# Altium schematic sheet POWER.SchDoc
size 381 x 241 mm; SheetNumber: 3; SheetTotal: 3
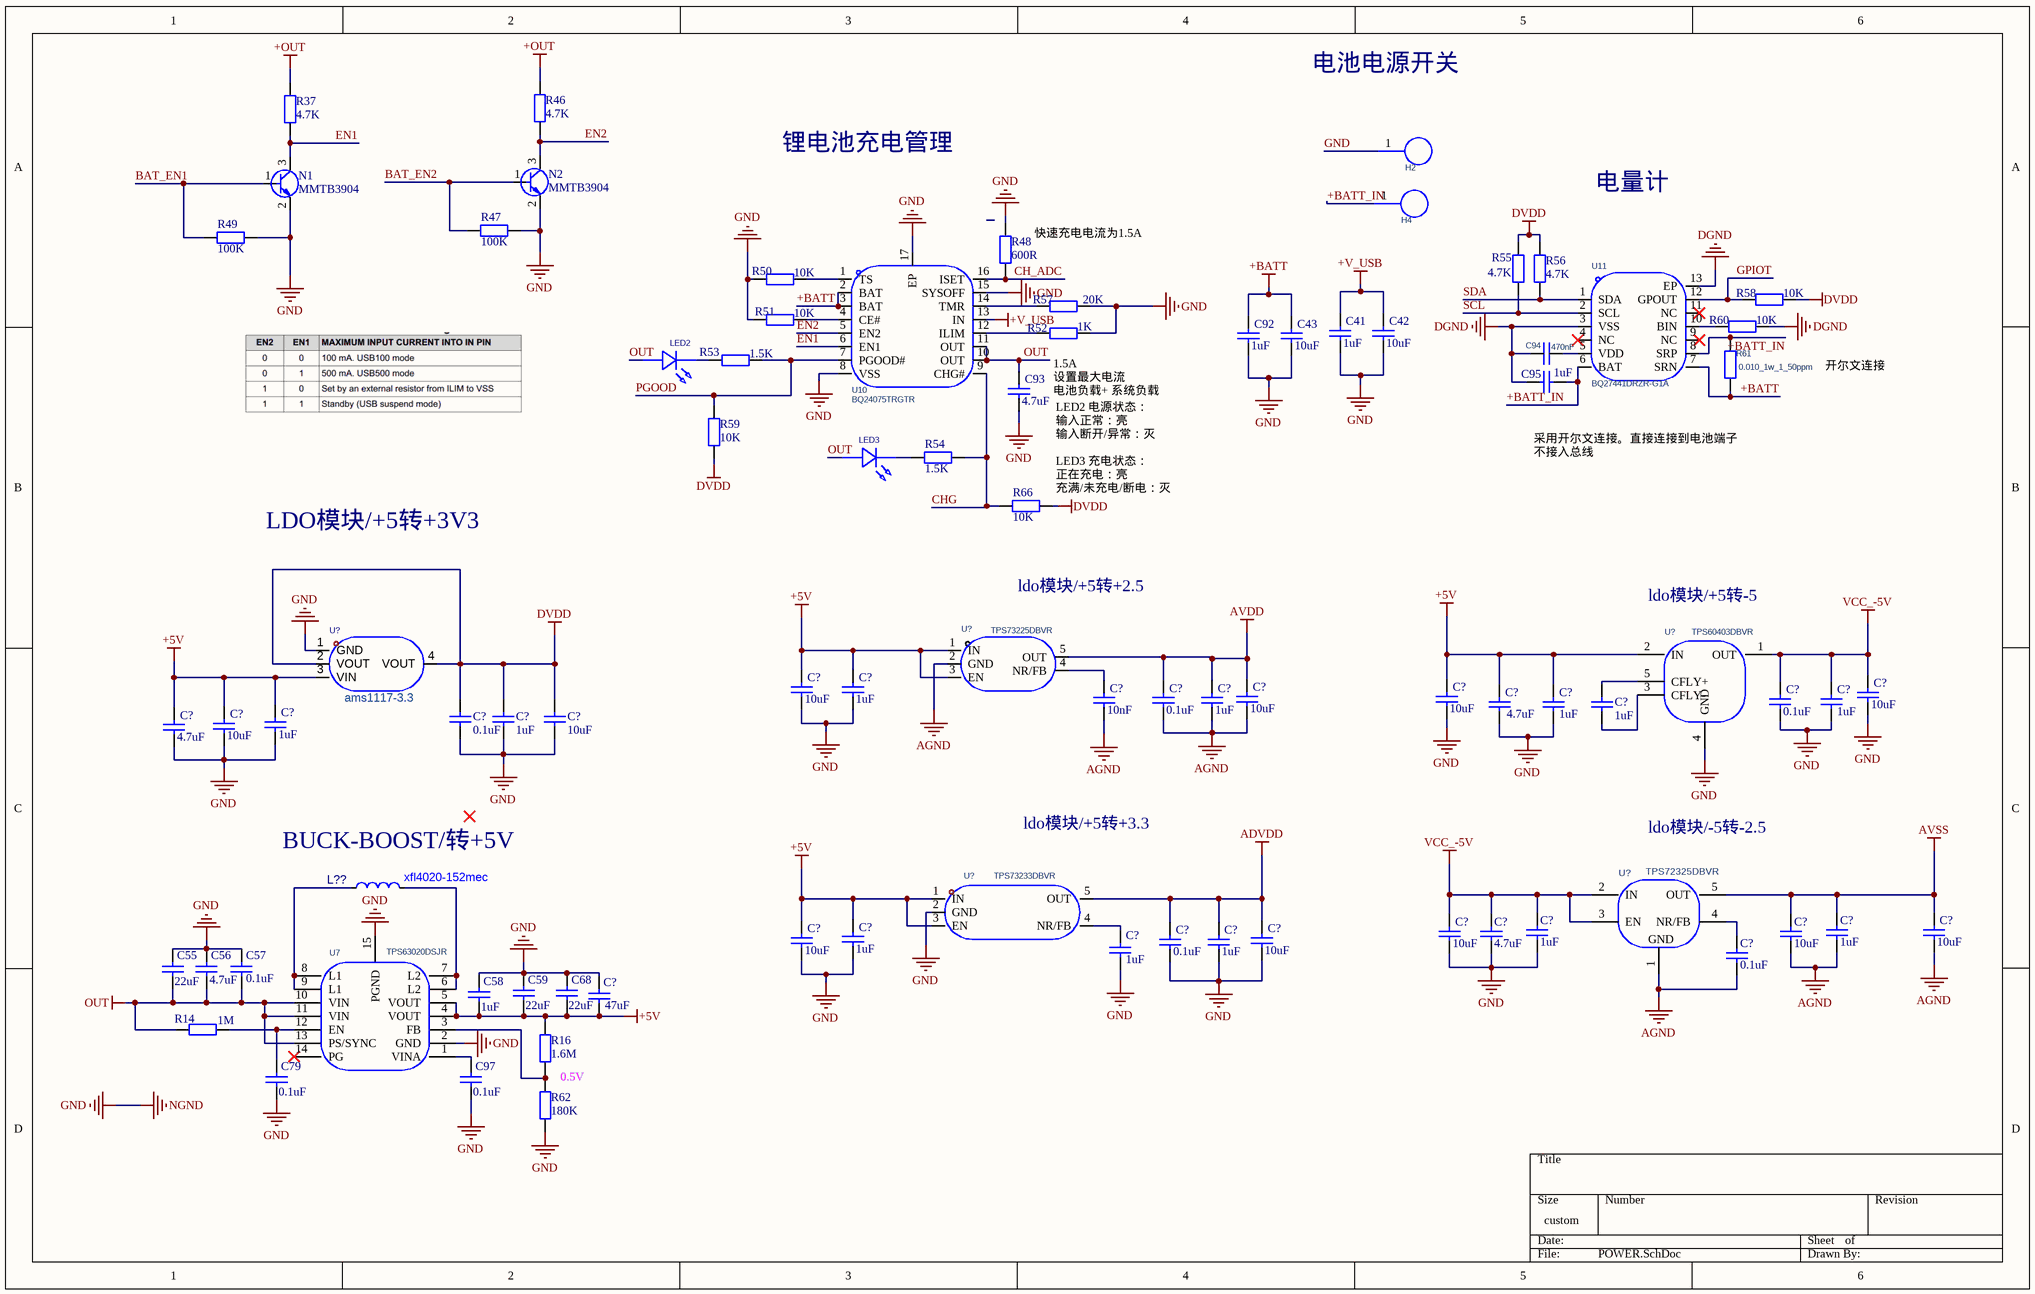
[diagram p0: POWER.SchDoc]

## Parts
(Parts that share a designator on the sheet are numbered #1, #2 ... from top to bottom, then left to right.)
C41  1uF  [C0603]
C42  10uF  [C0603]
C43  10uF  [C0603]
C55  22uF  [C0603]
C56  4.7uF  [C0603]
C57  0.1uF  [C0603]
C58  1uF  [C0603]
C59  22uF  [C0603]
C68  22uF  [C0603]
C79  0.1uF  [C0603]
C92  1uF  [C0603]
C93  4.7uF  [C0603]
C94  470nF  [C1206]
C95  1uF  [C0603]
C97  0.1uF  [C0603]
C?#1  10uF  [C0603]
C?#2  1uF  [C0603]
C?#3  10uF  [C0603]
C?#4  10nF  [C0603]
C?#5  0.1uF  [C0603]
C?#6  1uF  [C0603]
C?#7  10uF  [C0603]
C?#8  10uF  [C0603]
C?#9  4.7uF  [C0603]
C?#10  1uF  [C0603]
C?#11  1uF  [C0603]
C?#12  0.1uF  [C0603]
C?#13  1uF  [C0603]
C?#14  1uF  [C0603]
C?#15  0.1uF  [C0603]
C?#16  1uF  [C0603]
C?#17  10uF  [C0603]
C?#18  4.7uF  [C0603]
C?#19  10uF  [C0603]
C?#20  4.7uF  [C0603]
C?#21  1uF  [C0603]
C?#22  10uF  [C0603]
C?#23  1uF  [C0603]
C?#24  10uF  [C0603]
C?#25  10uF  [C0603]
C?#26  10uF  [C0603]
C?#27  1uF  [C0603]
C?#28  10uF  [C0603]
C?#29  0.1uF  [C0603]
C?#30  1uF  [C0603]
C?#31  0.1uF  [C0603]
C?#32  1uF  [C0603]
C?#33  47uF  [C0603]
H2  PZ254V-11-01P  [HDR-TH_1P-P2.54-V-M]  (value not drawn)
H4  PZ254V-11-01P  [HDR-TH_1P-P2.54-V-M]  (value not drawn)
L??  xfl4020-152mec  [IND-SMD_L4.0-W4.0-A]
LED2  XL-1608SURC-06  [LED0603-RD_RED]  (value not drawn)
LED3  XL-1608SURC-06  [LED0603-RD_RED]  (value not drawn)
N1  MMTB3904  [SOT-23-3_L2.9-W1.3-P1.90-LS2.4-BR - duplicate]
N2  MMTB3904  [SOT-23-3_L2.9-W1.3-P1.90-LS2.4-BR - duplicate]
R14  1M  [R0603]
R16  1.6M  [R0603]
R37  4.7K  [R0603]
R46  4.7K  [R0603]
R47  100K  [R0603]
R48  600R  [R0603]
R49  100K  [R0603]
R50  10K  [R0603]
R51  10K  [R0603]
R52  1K  [R0603]
R53  1.5K  [R0603]
R54  1.5K  [R0603]
R55  4.7K  [R0603]
R56  4.7K  [R0603]
R57  20K  [R0603]
R58  10K  [R0603]
R59  10K  [R0603]
R60  10K  [R0603]
R61  0.010_1w_1_50ppm  [R2512]
R62  180K  [R0603]
R66  10K  [R0603]
U7  TPS63020DSJR  [VSON-14_L4.0-W3.0-P0.50-BL-EP_TI_DSJ]
U10  BQ24075TRGTR  [VQFN-16_L3.0-W3.0-P0.50-TL-EP1.7]
U11  BQ27441DRZR-G1A  [SON-12_L4.0-W2.5-P0.40-BL-EP]
U?#1  ams1117-3.3  [SOT-223-3_L6.5-W3.4-P2.30-LS7.0-BR]
U?#2  TPS73225DBVR  [SOT-23-5_L2.9-W1.6-P0.95-LS2.8-TL]
U?#3  TPS60403DBVR  [SOT-23-5_L3.0-W1.7-P0.95-LS2.8-BR]
U?#4  TPS73233DBVR  [SOT-23-5_L3.0-W1.7-P0.95-LS2.8-BL]
U?#5  TPS72325DBVR  [SOT-23-5_L3.0-W1.7-P0.95-LS2.8-BR]

## Nets
+5V: C58.1 C59.1 C68.1 C?#1.2 C?#2.2 C?#8.2 C?#9.2 C?#10.2 C?#14.2 C?#18.2 C?#19.2 C?#26.2 C?#27.2 C?#33.1 R16.2 U7.4(VOUT) U7.5(VOUT) U?#1.3(VIN) U?#2.1(IN) U?#2.3(EN) U?#3.2(IN) U?#4.1(IN) U?#4.3(EN)
+BATT: C43.2 C92.2 R61.1 U10.2(BAT) U10.3(BAT) U11.7(SRN)
+OUT: R37.2 R46.2
+V_USB: C41.2 C42.2 U10.13(IN)
ADVDD: C?#28.2 C?#29.2 C?#30.2 U?#4.5(OUT)
AGND: C?#4.1 C?#5.1 C?#6.1 C?#7.1 C?#22.2 C?#23.2 C?#25.1 C?#31.2 U?#2.2(GND) U?#5.1(GND)
AVDD: C?#5.2 C?#6.2 C?#7.2 U?#2.5(OUT)
AVSS: C?#22.1 C?#23.1 C?#25.2 U?#5.5(OUT)
DGND: C94.2 C95.2 R60.1 U11.3(VSS) U11.13(EP)
DVDD: C?#15.2 C?#16.2 C?#17.2 R55.1 R56.1 R58.1 R59.2 R66.2 U?#1.2(VOUT) U?#1.4(VOUT)
GND: C41.1 C42.1 C43.1 C55.2 C56.1 C57.1 C58.2 C59.2 C68.2 C79.1 C92.1 C93.1 C97.1 C?#1.1 C?#2.1 C?#3.1 C?#8.1 C?#9.1 C?#10.1 C?#12.1 C?#13.1 C?#14.1 C?#15.1 C?#16.1 C?#17.1 C?#18.1 C?#19.1 C?#20.2 C?#21.2 C?#24.1 C?#26.1 C?#27.1 C?#28.1 C?#29.1 C?#30.1 C?#32.1 C?#33.2 H2.1 N1.2 N2.2 R47.1 R48.1 R49.1 R50.2 R51.2 R52.1 R57.1 R62.1 U7.2(GND) U7.15(PGND) U10.8(VSS) U10.15(SYSOFF) U10.17(EP) U?#1.1(GND) U?#3.4(GND) U?#4.2(GND)  [also labelled NGND]
OUT: C55.1 C56.2 C57.2 C93.2 LED2.2(A) LED3.2(A) R14.1 U7.10(VIN) U7.11(VIN) U7.13(PS/SYNC) U10.10(OUT) U10.11(OUT)
VCC_-5V: C?#3.2 C?#12.2 C?#13.2 C?#20.1 C?#21.1 C?#24.2 U?#3.1(OUT) U?#5.2(IN) U?#5.3(EN)
+BATT_IN: C95.1 H4.1 R61.2 U11.6(BAT) U11.8(SRP)
BAT_EN1: N1.1 R49.2
BAT_EN2: N2.1 R47.2
CH_ADC: R48.2 U10.16(ISET)
CHG: R54.1 R66.1 U10.9(CHG#)
EN1: N1.3 R37.1 U10.6(EN1)
EN2: N2.3 R46.1 U10.5(EN2)
GPIOT: R58.2 U11.12(GPOUT)
PGOOD: R53.1 R59.1 U10.7(PGOOD#)
SCL: R55.2 U11.2(SCL)
SDA: R56.2 U11.1(SDA)
NetC79_2: C79.2 R14.2 U7.12(EN)
NetC94_1: C94.1 U11.5(VDD)
NetC97_2: C97.2 U7.1(VINA)
NetC?#4_2: C?#4.2 U?#2.4(NR/FB)
NetC?#11_1: C?#11.1 U?#3.3(CFLY-)
NetC?#11_2: C?#11.2 U?#3.5(CFLY+)
NetC?#31_1: C?#31.1 U?#5.4(NR/FB)
NetC?#32_2: C?#32.2 U?#4.4(NR/FB)
NetL??_1: L??.1 U7.8(L1) U7.9(L1)
NetL??_2: L??.2 U7.6(L2) U7.7(L2)
NetLED2_1: LED2.1(K) R53.2
NetLED3_1: LED3.1(K) R54.2
NetR16_1: R16.1 R62.2 U7.3(FB)
NetR50_1: R50.1 U10.1(TS)
NetR51_1: R51.1 U10.4(CE#)
NetR52_2: R52.2 U10.12(ILIM)
NetR57_2: R57.2 U10.14(TMR)
NetR60_2: R60.2 U11.10(BIN)

Not connected (* = marked no-connect by the designer): U7 14(PG)*; U11 4(NC)* 9(NC)* 11(NC)*

## Notes on the sheet
- 电池电源开关
- 锂电池充电管理
- 电量计
- (near R48) 快速充电电流为1.5A
- 开尔文连接
- 1.5A
  设置最大电流
  电池负载+ 系统负载
- (near R66) LED2 电源状态：
  输入正常：亮
  输入断开/异常：灭
  LED3 充电状态：
  正在充电：亮
  充满/未充电/断电：灭
- 采用开尔文连接。直接连接到电池端子
  不接入总线
- LDO模块/+5转+3V3
- ldo模块/+5转+2.5
- (near U?#3) ldo模块/+5转-5
- ldo模块/+5转+3.3
- ldo模块/-5转-2.5
- (near L??) BUCK-BOOST/转+5V
- 0.5V

## Library data of the parts
C41-C43 C92 C?#1 C?#3 C?#6-C?#9 C?#12 C?#21 C?#22 C?#24-C?#26 C?#28 C?#30 = C0603: CAP CER 10UF 10V, 10% X5R 0603; Value: 104; Published: 8-Jun-2000; LatestRevisionDate: 17-Jul-2002; LatestRevisionNote: Re-released for DXP Platform.; Publisher: Altium Limited
C55-C59 C68 C79 C97 C?#33 = C0603: Capacitor; Value: 104; Published: 8-Jun-2000; LatestRevisionDate: 17-Jul-2002; LatestRevisionNote: Re-released for DXP Platform.; Publisher: Altium Limited
C93 = C0603: CAP CER 4.7UF 10V, 10% X5R 0603; Value: 104; Published: 8-Jun-2000; LatestRevisionDate: 17-Jul-2002; LatestRevisionNote: Re-released for DXP Platform.; Publisher: Altium Limited
C94 = C1206: Manufacturer: YAGEO(国巨); Symbol: CC1206KKX7R9BB474; Add into BOM: yes; Tolerance: ±10%; Voltage Rated: 50V; Temperature Coefficient: X7R; Device: CC1206KKX7R9BB474; LCSC Part Name: 470nF ±10% 50V; Supplier Part: C277483; Manufacturer Part: CC1206KKX7R9BB474; Supplier Footprint: 1206; JLCPCB Part Class: Extended Part; Datasheet: https://atta.szlcsc.com/upload/public/pdf/source/20181008/C309510_22F155564471FAF6A489F7D68F34234E.pdf; Supplier: LCSC; Convert to PCB: yes; Value: 470nF
C95 C?#2 C?#10 C?#11 C?#13 C?#23 C?#27 C?#32 = C0603: CAP CER 1UF 25V, 10% X5R 0603; Value: 104; Published: 8-Jun-2000; LatestRevisionDate: 17-Jul-2002; LatestRevisionNote: Re-released for DXP Platform.; Publisher: Altium Limited
C?#4 = C0603: CAP CER 10nF 50V, 10% X5R 0805; Value: 104; Published: 8-Jun-2000; LatestRevisionDate: 17-Jul-2002; LatestRevisionNote: Re-released for DXP Platform.; Publisher: Altium Limited
C?#5 C?#20 C?#29 = C0603: CAP CER 2.2UF 16V, 10% X5R 0805; Value: 104; Published: 8-Jun-2000; LatestRevisionDate: 17-Jul-2002; LatestRevisionNote: Re-released for DXP Platform.; Publisher: Altium Limited
C?#14 C?#16 = C0603: CAP CER 1UF 25V, 10% X7R 0603; Value: 104; Published: 8-Jun-2000; LatestRevisionDate: 17-Jul-2002; LatestRevisionNote: Re-released for DXP Platform.; Publisher: Altium Limited
C?#15 = C0603: CAP CER 0.1UF 25V, 10% X7R 0603; Value: 104; Published: 8-Jun-2000; LatestRevisionDate: 17-Jul-2002; LatestRevisionNote: Re-released for DXP Platform.; Publisher: Altium Limited
C?#17 C?#19 = C0603: CAP CER 10UF 25V, 10% X7R 0603; Value: 104; Published: 8-Jun-2000; LatestRevisionDate: 17-Jul-2002; LatestRevisionNote: Re-released for DXP Platform.; Publisher: Altium Limited
C?#18 = C0603: CAP CER 4.7uF 25V, 10% X7R 0603; Value: 104; Published: 8-Jun-2000; LatestRevisionDate: 17-Jul-2002; LatestRevisionNote: Re-released for DXP Platform.; Publisher: Altium Limited
C?#31 = C0603: CAP CER 0.1UF 50V, 10% X7R 0603; Value: 104; Published: 8-Jun-2000; LatestRevisionDate: 17-Jul-2002; LatestRevisionNote: Re-released for DXP Platform.; Publisher: Altium Limited
H2 H4 = PZ254V-11-01P: Manufacturer: XFCN(兴飞); Add into BOM: yes; Pin Structure: 1x1P; Pitch: 2.54mm; Circluar Pins/Square Pins: 方针; Symbol: PZ254V-11-01P; Device: PZ254V-11-01P; LCSC Part Name: 1x1P 间距:2.54mm 方针 直插; Supplier Part: C492400; Manufacturer Part: PZ254V-11-01P; Supplier Footprint: 插件,P=2.54mm; JLCPCB Part Class: Extended Part; Datasheet: https://atta.szlcsc.com/upload/public/pdf/source/20200309/C492400_46876A5B545F5AE6B8D4A09C46E276E8.pdf; Supplier: LCSC; Convert to PCB: yes; Row Spacing: -; Mounting Type: 直插; Number of Rows: 单排; Number of Pins: 1P; Current Rating: -; Voltage Rating (Max): -; Length of Mating Pin: 6mm; Insulation Height: 2.5mm; Length of End Connection Pin: 3mm; Contact Material: 黄铜; Contact Plating: -; Operating Temperature: -40℃~+105℃; Color: 黑色
L?? = xfl4020-152mec: 电感值:1.5uH;精度:±20%;额定电流:-;饱和电流(Isat):-;类型:磁胶屏蔽电感;; Manufacturer: Coilcraft(线艺); AddInBom: yes; ModelId: 917e580a727645d0bd5a33a187108a81; ModelTransform: 157.48,157.484,0,0,0,0,0,0,0; Value: 1.5uH; Tolerance: ±20%; Type: 磁胶屏蔽电感; Symbol: XFL4020-152MEC; LCSC Part Name: 1.5uH ±20%; SupplierPart: C3033018; ManufacturerPart: XFL4020-152MEC; Supplier Footprint: SMD,4x4mm; JLCPCB Part Class: Extended Part; Datasheet: https://www.coilcraft.com/getmedia/50632d43-da1b-4cdb-8ab4-3029cab51df3/xfl4020.pdf; Supplier: LCSC; ConvertToPcb: yes; FootprintName: IND-SMD_L4.0-W4.0-A; ModelName: IND-SMD_L4.0-W4.0-A; Current Rating: -; Current - Saturation(Isat): -; DC Resistance(DCR): -; Ratings: -
LED2 LED3 = XL-1608SURC-06: Manufacturer: XINGLIGHT(成兴光); Add into BOM: yes; Illumination Color: 红色; Voltage - Forward(Vf): 2.3V; Power(Watts): 50mW; Forward Current: 20mA; Wavelength - Dominant: 620nm~630nm; Peak Wavelength: 625nm; Lens Color: 无色透明透镜; Luminous Intensity: 225mcd; Viewing Angle: 120°; Mounting Sytle: 正贴; Symbol: XL-1608SURC-06; Device: XL-1608SURC-06; LCSC Part Name: XL-1608SURC-06; Supplier Part: C965799; Manufacturer Part: XL-1608SURC-06; Supplier Footprint: 0603; JLCPCB Part Class: Extended Part; Datasheet: https://atta.szlcsc.com/upload/public/pdf/source/20250213/F9766CE804AF391355DCDD48DB3E0DAB.pdf; Supplier: LCSC; Convert to PCB: yes; Lamp Holder Type: -; Diode Configuration: -; Color Temperature: -; Operating Temperature: -20℃~+85℃
R14 R16 R62 = R0603: Resistor; Published: 8-Jun-2000; LatestRevisionDate: 17-Jul-2002; LatestRevisionNote: Re-released for DXP Platform.; Publisher: Altium Limited
R37 R46 R47 R49-R51 R58 R60 = R0603: RES 12K OHM 1/10W 1% 0603 SMD; Published: 8-Jun-2000; LatestRevisionDate: 17-Jul-2002; LatestRevisionNote: Re-released for DXP Platform.; Publisher: Altium Limited
R48 = R0603: RES 887 OHM 1/10W 1% 0603 SMD; Published: 8-Jun-2000; LatestRevisionDate: 17-Jul-2002; LatestRevisionNote: Re-released for DXP Platform.; Publisher: Altium Limited
R52 R57 = R0603: RES 1.1K OHM 1/10W 1% 0603 SMD; Published: 8-Jun-2000; LatestRevisionDate: 17-Jul-2002; LatestRevisionNote: Re-released for DXP Platform.; Publisher: Altium Limited
R53 R54 R59 R66 = R0603: RES 1K OHM 1/10W 1% 0603 SMD; Published: 8-Jun-2000; LatestRevisionDate: 17-Jul-2002; LatestRevisionNote: Re-released for DXP Platform.; Publisher: Altium Limited
R55 R56 = R0603: RES 4.7K OHM 1/10W 1% 0603 SMD; Published: 8-Jun-2000; LatestRevisionDate: 17-Jul-2002; LatestRevisionNote: Re-released for DXP Platform.; Publisher: Altium Limited
R61 = RE2512F3R010: 采样电阻; Manufacturer: 捷而瑞; Add into BOM: yes; Value: 10mΩ; Tolerance: ±1%; Power(Watts): 3W; Temperature Coefficient: ±50ppm/℃; Symbol: RE2512F3R010; Device: RE2512F3R010; LCSC Part Name: 10mΩ 3W 2512 ±1%; Supplier Part: C46961753; Manufacturer Part: RE2512F3R010; Supplier Footprint: 2512; JLCPCB Part Class: Extended Part; Datasheet: https://atta.szlcsc.com/upload/public/pdf/source/20250325/401775B85EF7B3A580BC34DFED100CB2.pdf; Supplier: LCSC; Convert to PCB: yes; Type: 采样电阻
U7 = TPS63020DSJR: Manufacturer: TI(德州仪器); Add into BOM: yes; Function: 升降压型; Output Type: 可调; Voltage - Supply: 1.8V~5.5V; Output Voltage: 1.2V~5.5V; Output Current: 3A; Frequency - Switching: 2.4MHz; Synchronous Rectifier: 是; Number of Outputs: 1; Topology: 降压-升压式; Quiescent Current: 50uA; Switch tube (built-in/external): 内置; Symbol: TPS63020DSJR; Device: TPS63020DSJR; LCSC Part Name: 高效率单电感升降压转换器; Supplier Part: C15483; Manufacturer Part: TPS63020DSJR; Supplier Footprint: VSON-14-EP(3x4); JLCPCB Part Class: Extended Part; Datasheet: https://www.ti.com/cn/lit/gpn/tps63020; Supplier: LCSC; Convert to PCB: yes; Operating Temperature: -40℃~+85℃@(TA)
U10 = BQ24075TRGTR: Manufacturer: TI(德州仪器); Add into BOM: yes; Symbol: BQ24075TRGTR; Device: BQ24075TRGTR; LCSC Part Name: BQ24075TRGTR; Supplier Part: C544783; Manufacturer Part: BQ24075TRGTR; Supplier Footprint: VQFN-16-EP(3x3); JLCPCB Part Class: Extended Part; Datasheet: https://www.ti.com/cn/lit/gpn/bq24079t; Supplier: LCSC; Convert to PCB: yes
U11 = BQ27441DRZR-G1A: Manufacturer: TI(德州仪器); Add into BOM: yes; Voltage - Supply: 2.45V~4.5V; Charging Saturation Voltage: 4.2V; Type of Battery: 锂离子/聚合物; Number of Cells: 1; Symbol: BQ27441DRZR-G1A; Device: BQ27441DRZR-G1A; LCSC Part Name: BQ27441DRZR-G1A; Supplier Part: C473397; Manufacturer Part: BQ27441DRZR-G1A; Supplier Footprint: SON-12-EP(2.5x4); JLCPCB Part Class: Extended Part; Datasheet: https://www.ti.com/cn/lit/gpn/bq27441-g1; Supplier: LCSC; Convert to PCB: yes
U?#1 = ams1117-3.3_c6186: 输出极性:正极;工作电压:15V;输出电压:3.3V;输出电流:1A;电源纹波抑制比(PSRR):72dB@(120Hz);输出类型:固定;; Manufacturer: Advanced Monolithic Systems; AddInBom: yes; ModelId: 925194bf9823436183a3e0b978a8d076; ModelName: SOT-223-4P_L6.5-W3.5-H1.6-LS7.0-P2.30; ModelTransform: 279.89794,255.905,0,180,0,0,-3.9385,-0.0005,0; Output Configuration: 正极; Voltage - Supply: 15V; Output Voltage: 3.3V; Output Current: 1A; Voltage Dropout: 1.1V@(800mA); standby current: 5mA; Noise: 0.003%Vout; Output Type: 固定; Number of Outputs: 1; LCSC Part Name: 3.3V 1A 15V; SupplierPart: C6186; ManufacturerPart: AMS1117-3.3; Supplier Footprint: SOT-223; JLCPCB Part Class: Basic Part; Datasheet: https://item.szlcsc.com/datasheet/AMS1117-3.3/6652.html; Supplier: LCSC; ConvertToPcb: yes; SymbolName: AMS1117-3.3; FootprintName: SOT-223-3_L6.5-W3.4-P2.30-LS7.0-BR; Power Supply Rejection Ratio (PSRR): 72dB@(120Hz); Features: 短路保护；热关断；过流保护; Operating Temperature: -40℃~+125℃
U?#2 = TPS73225DBVR: Manufacturer: TI(德州仪器); Add into BOM: yes; Output Type: 固定; Maximum Input Voltage: 5.5V; Output Voltage: 2.5V; Output Current: 250mA; Dropout Voltage: 150mV@(250mA); standby current: 550uA; Output Polarity: 正极; Number of Outputs: 1; Symbol: TPS73225DBVR; Device: TPS73225DBVR; LCSC Part Name: 具有反向电流保护和使能功能的 250mA、高精度、超低压降稳压器; Supplier Part: C2758473; Manufacturer Part: TPS73225DBVR; Supplier Footprint: SOT-23-5; JLCPCB Part Class: Extended Part; Datasheet: https://www.ti.com/cn/lit/gpn/tps732; Supplier: LCSC; Convert to PCB: yes; Feature: 防静电保护；过压保护(OVP)；低ESR；热保护(TSD)；过流保护(OCP)；带使能；带电荷泵；防倒灌; Operating Temperature: -40℃~+125℃
U?#3 = TPS60403DBVR: Manufacturer: TI(德州仪器); Add into BOM: yes; Symbol: TPS60403DBVR; Device: TPS60403DBVR; LCSC Part Name: TPS60403DBVR; Supplier Part: C11338; Manufacturer Part: TPS60403DBVR; Supplier Footprint: SOT-23-5; JLCPCB Part Class: Extended Part; Datasheet: https://www.ti.com/cn/lit/gpn/tps60403; Supplier: LCSC; Convert to PCB: yes
U?#4 = TPS73233DBVR: Manufacturer: TI(德州仪器); Add into BOM: yes; Output Type: 固定; Maximum Input Voltage: 5.5V; Output Voltage: 3.3V; Output Current: 250mA; Power Supply Rejection Ratio (PSRR): 58dB@(100Hz)；37dB@(10kHz); Dropout Voltage: 150mV@(250mA); standby current: 550uA; Output Polarity: 正极; Number of Outputs: 1; Symbol: TPS73233DBVR; Device: TPS73233DBVR; LCSC Part Name: 具有反向电流保护和使能功能的 250mA、高精度、超低压降稳压器; Supplier Part: C181459; Manufacturer Part: TPS73233DBVR; Supplier Footprint: SOT-23-5; JLCPCB Part Class: Extended Part; Datasheet: https://www.ti.com/cn/lit/gpn/tps732; Supplier: LCSC; Convert to PCB: yes; Feature: 防静电保护；过压保护(OVP)；低ESR；热保护(TSD)；过流保护(OCP)；带使能；带电荷泵；防倒灌; Operating Temperature: -40℃~+125℃
U?#5 = TPS72325DBVR: Manufacturer: TI(德州仪器); Add into BOM: yes; Output Type: 固定; Maximum Input Voltage: 10V; Output Voltage: 2.5V; Output Current: 200mA; Power Supply Rejection Ratio (PSRR): 65dB; Dropout Voltage: 500mV@(200mA); standby current: 200uA; Output Polarity: 负极; Number of Outputs: 1; Symbol: TPS72325DBVR; Device: TPS72325DBVR; LCSC Part Name: 输入10V 输出2.5V 200mA; Supplier Part: C69932; Manufacturer Part: TPS72325DBVR; Supplier Footprint: SOT-23-5; JLCPCB Part Class: Extended Part; Datasheet: https://www.ti.com/cn/lit/gpn/tps723; Supplier: LCSC; Convert to PCB: yes; Feature: 防静电保护；低ESR；热保护(TSD)；过流保护(OCP)；带使能；防倒灌; Operating Temperature: -40℃~+125℃
N1 N2 = MMTB3904: Part Number: *; Brand: *